# Altium schematic sheet Block_Diagram.SchDoc
size A4; SheetNumber: 1; SheetTotal: 7
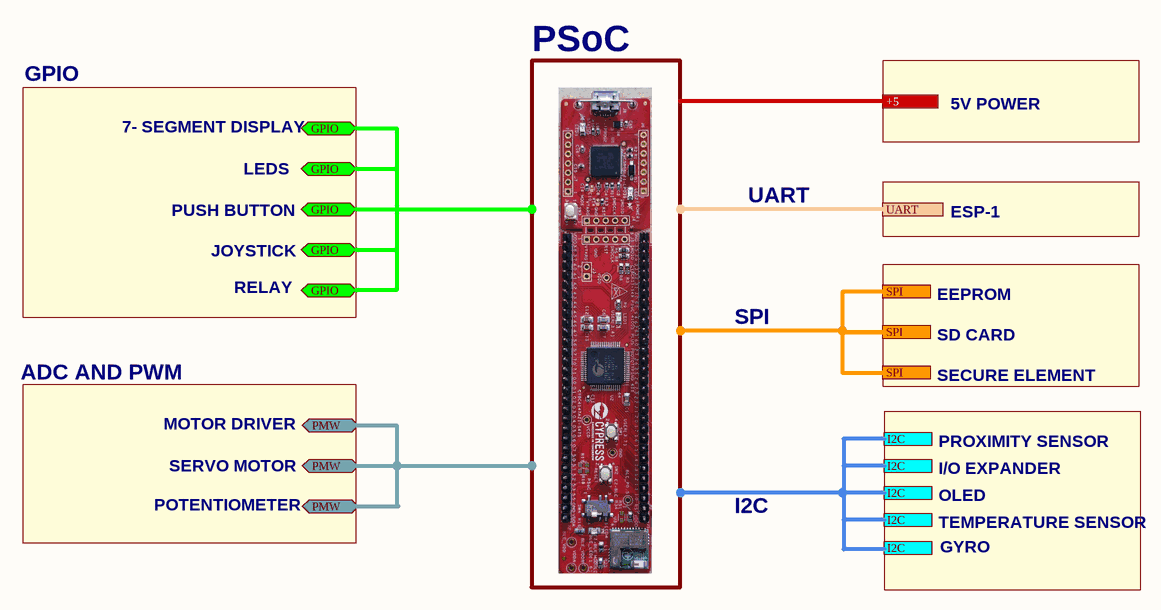
[diagram p0: Block_Diagram.SchDoc]

## Ports
+5, GPIO (bidir, see Block_Diagram[2B]), GPIO (bidir, see Block_Diagram[2B], Block_Diagram[2C]), I2C (see Block_Diagram[3C]), I2C (see Block_Diagram[3C], Block_Diagram[3D]), PMW (bidir, see Block_Diagram[2C]), SPI (see Block_Diagram[3C]), UART

## Notes on the sheet
- GPIO
- PSoC
- 7- SEGMENT DISPLAY
- 5V POWER
- PUSH BUTTON
- LEDS
- UART
- ESP-1
- JOYSTICK
- RELAY
- SPI
- EEPROM
- SD CARD
- ADC AND PWM
- SECURE ELEMENT
- MOTOR DRIVER
- SERVO MOTOR
- PROXIMITY SENSOR
- I/O EXPANDER
- POTENTIOMETER
- I2C
- OLED
- TEMPERATURE SENSOR
- GYRO